# Altium project Battery ORing.PrjPcb
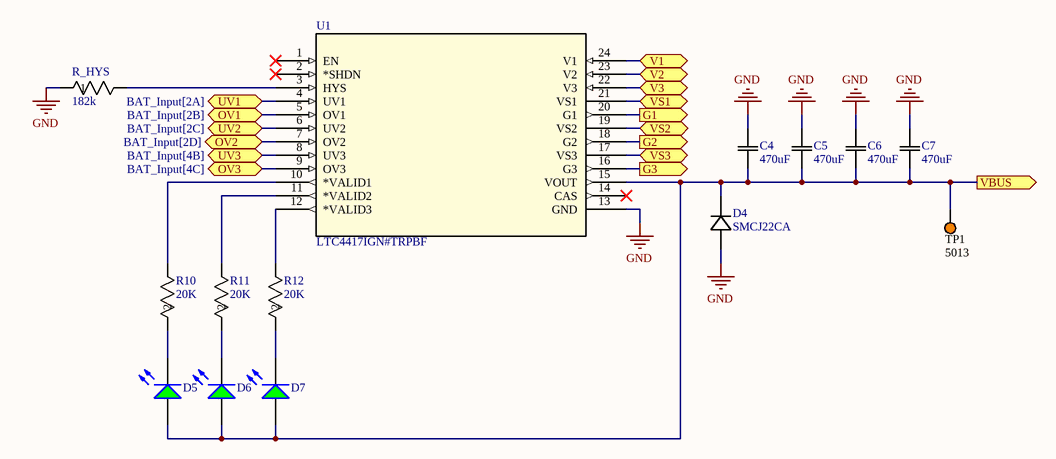
[diagram p0: Battery_Logic.SchDoc]
4 sheets, 116 parts. Net scope: flat (ports and power ports of the same name join across sheets).
Board file: Power_MUX_PCB.PcbDoc
Sheets:
  Battery_Logic.SchDoc
  FET_PowerPath.SchDoc
  BAT_Input.SchDoc
  Buck_Converter.SchDoc

## Sheet Battery_Logic.SchDoc
size A; SheetNumber: 1; SheetTotal: 4

### Parts
C4  470uF  [CAP_EEHZ-G16_PAN]
C5  470uF  [CAP_EEHZ-G16_PAN]
C6  470uF  [CAP_EEHZ-G16_PAN]
C7  470uF  [CAP_EEHZ-G16_PAN]
D4  SMCJ22CA  [SMCJSeries_LTF]
D5  597-3311-407F  [DIAL-597-3311-407F_V]  (value not drawn)
D6  597-3311-407F  [DIAL-597-3311-407F_V]  (value not drawn)
D7  597-3311-407F  [DIAL-597-3311-407F_V]  (value not drawn)
R10  20K  [RC0603N_PAN]
R11  20K  [RC0603N_PAN]
R12  20K  [RC0603N_PAN]
R_HYS  182k  [RES_RMCF0603_STP]
TP1  5013  [KSTN-5013_V]
U1  LTC4417IGN#TRPBF  [SSOP-24_GN_LIT]

### Ports
G1 (out, see FET_PowerPath[3A], FET_PowerPath[4A]), G2 (out, see FET_PowerPath[3C], FET_PowerPath[4C]), G3 (out, see FET_PowerPath[3D], FET_PowerPath[4D]), OV1 (bidir, see BAT_Input[2B]), OV2 (bidir, see BAT_Input[2D]), OV3 (bidir, see BAT_Input[4C]), UV1 (bidir, see BAT_Input[2A]), UV2 (bidir, see BAT_Input[2C]), UV3 (bidir, see BAT_Input[4B]), V1 (bidir, see BAT_Input[2A], FET_PowerPath[2A]), V2 (bidir, see BAT_Input[2C], FET_PowerPath[2B]), V3 (bidir, see BAT_Input[4B], FET_PowerPath[2C]), VBUS (out, see Buck_Converter[1C], FET_PowerPath[5A], FET_PowerPath[5B], FET_PowerPath[5C]), VS1 (bidir, see FET_PowerPath[4B]), VS2 (bidir, see FET_PowerPath[4C]), VS3 (bidir, see FET_PowerPath[4D])

### Nets
GND: C4.2 C5.2 C6.2 C7.2 D4.2 R_HYS.1 U1.13(GND)
VBAT1: U1.24(V1) ; port V1
VBAT2: U1.23(V2) ; port V2
VBAT3: U1.22(V3) ; port V3
VBUS: C4.1 C5.1 C6.1 C7.1 D4.1 D5.1(A) D6.1(A) D7.1(A) TP1.1 U1.15(VOUT) ; port VBUS
NetC1_1: U1.4(UV1) ; port UV1
NetC2_1: U1.6(UV2) ; port UV2
NetC3_2: U1.8(UV3) ; port UV3
NetC_VS1_1: U1.21(VS1) ; port VS1
NetC_VS2_1: U1.19(VS2) ; port VS2
NetC_VS3_1: U1.17(VS3) ; port VS3
NetD5_2: D5.2(K) R10.2
NetD6_2: D6.2(K) R11.2
NetD7_2: D7.2(K) R12.2
NetR1_2: U1.5(OV1) ; port OV1
NetR4_2: U1.7(OV2) ; port OV2
NetR7_2: U1.9(OV3) ; port OV3
NetR10_1: R10.1 U1.10(*VALID1)
NetR11_1: R11.1 U1.11(*VALID2)
NetR12_1: R12.1 U1.12(*VALID3)
NetR13_2: U1.20(G1) ; port G1
NetR17_2: U1.18(G2) ; port G2
NetR21_2: U1.16(G3) ; port G3
NetR_HYS_2: R_HYS.2 U1.3(HYS)

Not connected (* = marked no-connect by the designer): U1 1(EN)* 2(*SHDN)* 14(CAS)*

### Library data of the parts
C4-C7 = EEHZU1V471V: Description; Manufacturer_Name: Panasonic; Copyright: Copyright (C) 2025 Ultra Librarian. All rights reserved.; Manufacturer_Part_Number: EEHZU1V471V
D4 = SMCJ22CA: No Description Available; Manufacturer_Name: Littelfuse Inc; Copyright: Copyright (C) 2026 Ultra Librarian. All rights reserved.; Manufacturer_Part_Number: SMCJ22CA
D5-D7 = CMP-2000-05651-1: LED Green, 75 mW, 30 mA, -30 to 85 degC, 2-Pin SMD, RoHS, Tape and Reel; Manufacturer: Dialight; Product Depth (mm): 1.5mm; Viewing Angle: 70deg; DELETED: Compliant; Number of  Elements: 1; Emitting Color: YellowGreen; Shape Type: Rectangular; Product Length (mm): 3mm; Forward Current: 30mA; Main Category: ChipLED; Luminous Intensity: 7.5mcd; Type: Uni-Color; High Brightness: No; Test Current (It): 20mA; Lens Type: NonDiffused; Reverse Voltage: 4V; Peak Wavelength: 560nm; Power Dissipation: 75W; Forward Voltage: 2.5V; Chip Material: GaP; Mounting: SurfaceMount; Product Height (mm): 1.5mm; Pin Count: 2; Datasheet URL: https://datasheet.ciiva.com/15117/getdatasheetpartid-142484-15117764.pdf; Mounting Technology: SurfaceMount; Rad Hardened: No; Operating Temperature Classification: Commercial; Lens Dimensions: 2x1.5x0.9mm; Operating Temp Range: -30Cto85C; Package Reference: 597-3311-407F; Package Type: SMD; Datasheet Version: 07/2002; Lum Intensity: 7.5mcd; Packaging: TapeandReel; Package Description: 2-Pin Surface Mount Device, Body 1.5 x 3 mm; Manufacturer URL: http://www.dialight.com/
R10-R12 = ERJ-3EKF2002V: Description; Manufacturer_Name: Panasonic; Copyright: Copyright (C) 2025 Ultra Librarian. All rights reserved.; Manufacturer_Part_Number: ERJ-3EKF2002V
R_HYS = RMCF0603FT182K: No Description Available; Manufacturer_Name: Stackpole International; Copyright: Copyright (C) 2026 Ultra Librarian. All rights reserved.; Manufacturer_Part_Number: RMCF0603FT182K
TP1 = CMP-1672-00005-4: Test Point, Orange, Through Hole, RoHS, Bulk; Manufacturer: Keystone; REACH SVHC: No SVHC; ComponentLink2Description: Datasheet; PackageDescription: 1-Pin Through Hole Device, Dia 3.17 mm; Package Quantity: 100; PackageReference: 5013; Contact Material: Bronze; DatasheetVersion: Rev. F, 12/2013; ComponentLink2URL: http://www.keyelco.com/product-pdf.cfm?p=1322; Contact Plating: Silver; ComponentLink1URL: http://www.keyelco.com/; Packaging: Bulk; ComponentLink1Description: Manufacturer URL; Colour: Orange; Height: 8.12 mm; RoHSCompliant: True; Mount: Through Hole; Mounting Technology: Through Hole
U1 = LTC4417IGNTRPBF: Prioritized PowerPathâ„¢ Controller; Manufacturer_Name: Analog Devices Inc; Copyright: Copyright (C) 2025 Ultra Librarian. All rights reserved.; Manufacturer_Part_Number: LTC4417IGN#TRPBF; RefDes: RefDes; Type: Type

## Sheet FET_PowerPath.SchDoc
size 299 x 299 mm; SheetNumber: 2; SheetTotal: 4
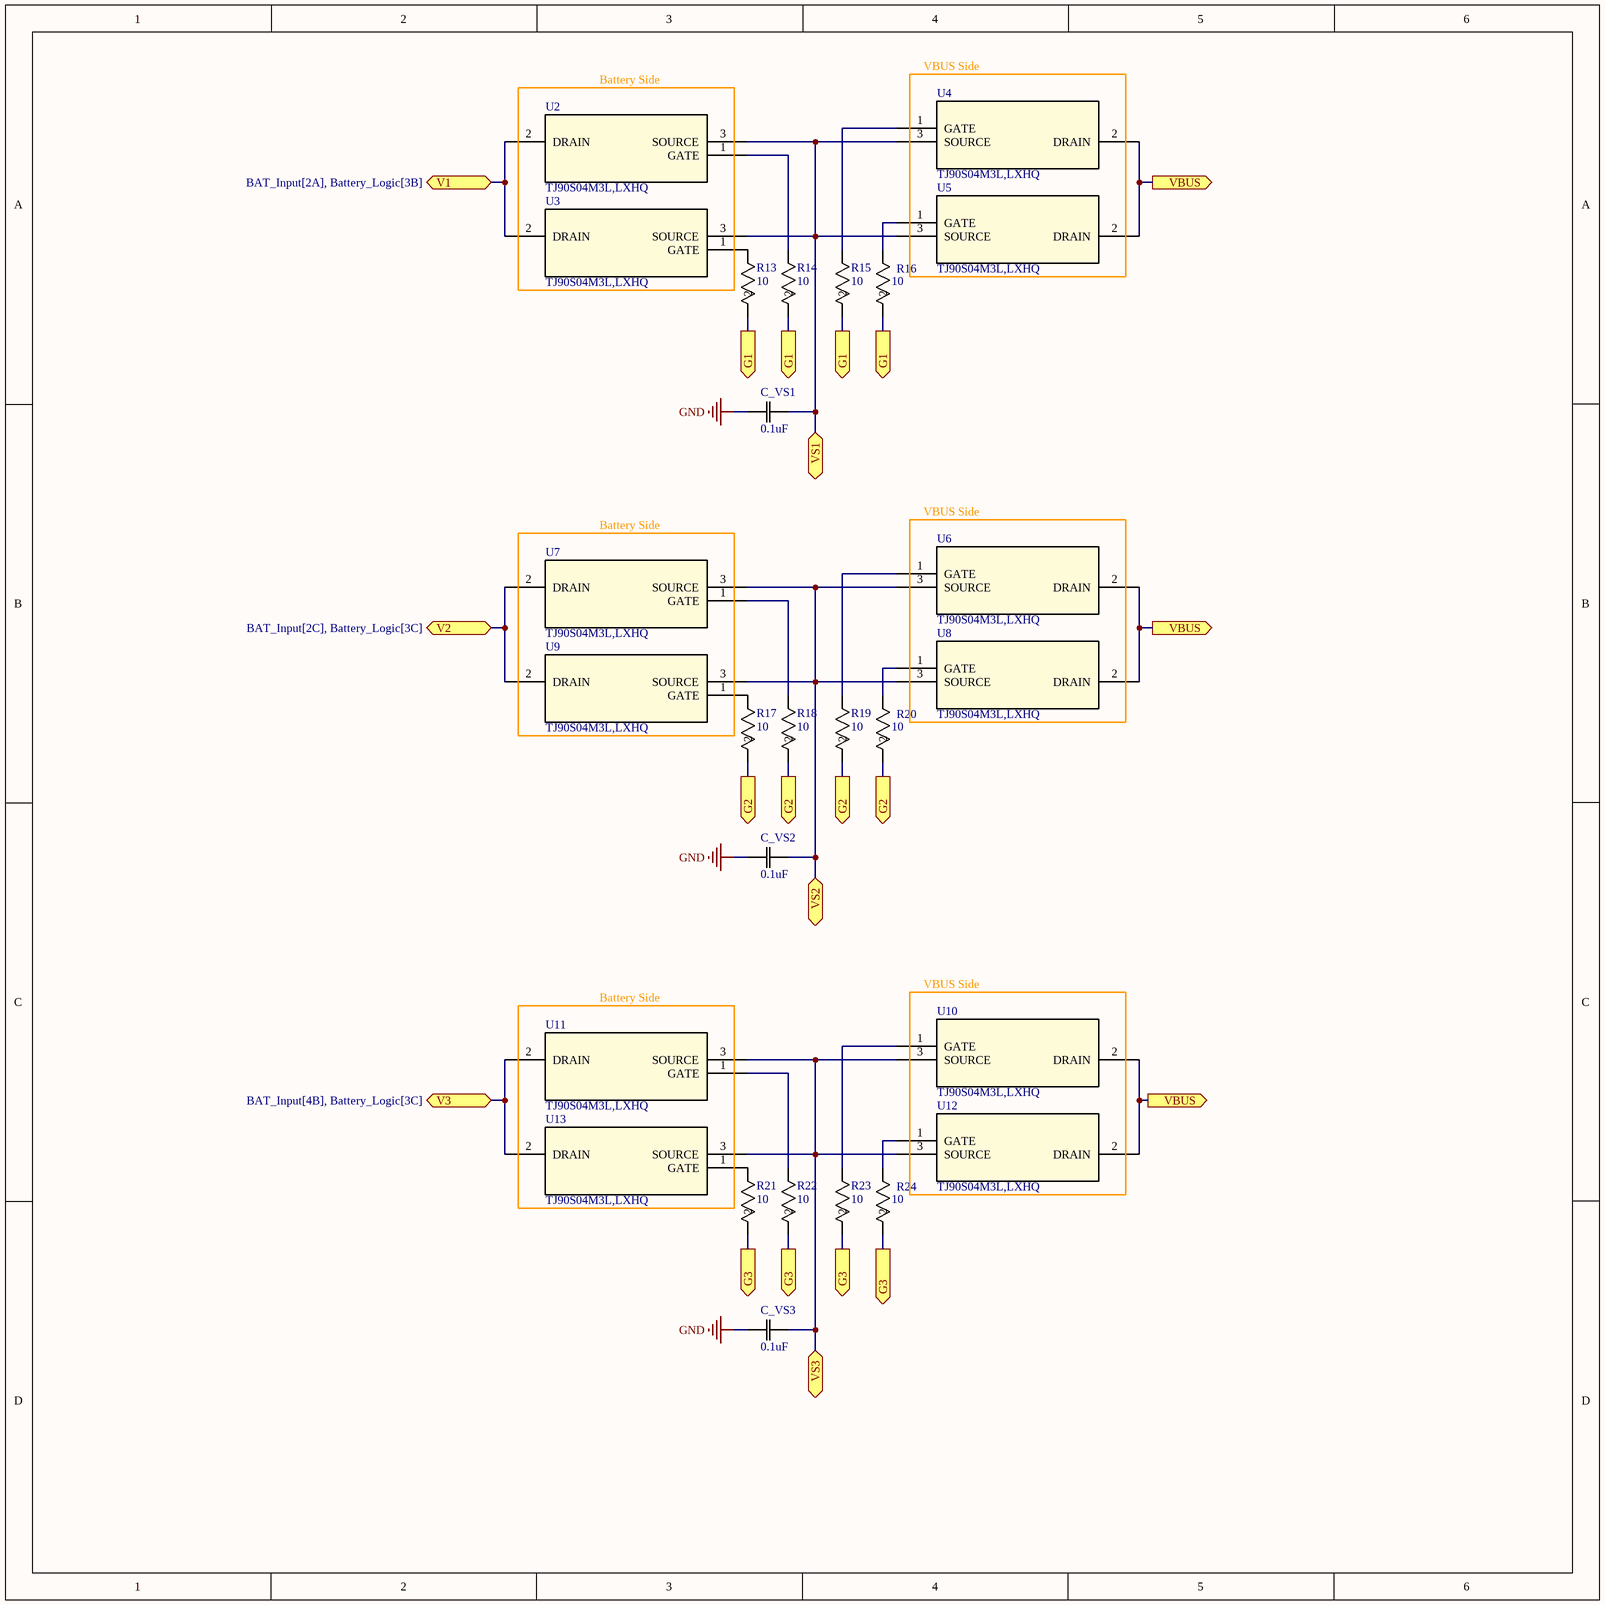
[diagram p1: FET_PowerPath.SchDoc]

### Parts
C_VS1  0.1uF  [CAP_GCM1555_0402_MUR]
C_VS2  0.1uF  [CAP_GCM1555_0402_MUR]
C_VS3  0.1uF  [CAP_GCM1555_0402_MUR]
R13  10  [RES_CRCW_0805]
R14  10  [RES_CRCW_0805]
R15  10  [RES_CRCW_0805]
R16  10  [RES_CRCW_0805]
R17  10  [RES_CRCW_0805]
R18  10  [RES_CRCW_0805]
R19  10  [RES_CRCW_0805]
R20  10  [RES_CRCW_0805]
R21  10  [RES_CRCW_0805]
R22  10  [RES_CRCW_0805]
R23  10  [RES_CRCW_0805]
R24  10  [RES_CRCW_0805]
U2  TJ90S04M3L,LXHQ  [DPAK+_TOS]
U3  TJ90S04M3L,LXHQ  [DPAK+_TOS]
U4  TJ90S04M3L,LXHQ  [DPAK+_TOS]
U5  TJ90S04M3L,LXHQ  [DPAK+_TOS]
U6  TJ90S04M3L,LXHQ  [DPAK+_TOS]
U7  TJ90S04M3L,LXHQ  [DPAK+_TOS]
U8  TJ90S04M3L,LXHQ  [DPAK+_TOS]
U9  TJ90S04M3L,LXHQ  [DPAK+_TOS]
U10  TJ90S04M3L,LXHQ  [DPAK+_TOS]
U11  TJ90S04M3L,LXHQ  [DPAK+_TOS]
U12  TJ90S04M3L,LXHQ  [DPAK+_TOS]
U13  TJ90S04M3L,LXHQ  [DPAK+_TOS]

### Blocks framed on the sheet
Battery Side: U2 U3
VBUS Side: U4 U5
Battery Side: U7 U9
VBUS Side: U6 U8
Battery Side: U11 U13
VBUS Side: U10 U12

### Ports
G1 (out, see Battery_Logic[3C], FET_PowerPath[3A], FET_PowerPath[4A]), G2 (out, see Battery_Logic[3C], FET_PowerPath[3C], FET_PowerPath[4C]), G3 (out, see Battery_Logic[3C], FET_PowerPath[3D], FET_PowerPath[4D]), V1 (bidir, see BAT_Input[2A], Battery_Logic[3B]), V2 (bidir, see BAT_Input[2C], Battery_Logic[3C]), V3 (bidir, see BAT_Input[4B], Battery_Logic[3C]), VBUS (out, see Battery_Logic[4C], Buck_Converter[1C], FET_PowerPath[5A], FET_PowerPath[5B]), VBUS (out, see Battery_Logic[4C], Buck_Converter[1C], FET_PowerPath[5A], FET_PowerPath[5C]), VBUS (out, see Battery_Logic[4C], Buck_Converter[1C], FET_PowerPath[5B], FET_PowerPath[5C]), VS1 (bidir, see Battery_Logic[3C]), VS2 (bidir, see Battery_Logic[3C]), VS3 (bidir, see Battery_Logic[3C])

### Nets
GND: C_VS1.2 C_VS2.2 C_VS3.2
VBAT1: U2.2(DRAIN) U3.2(DRAIN) ; port V1
VBAT2: U7.2(DRAIN) U9.2(DRAIN) ; port V2
VBAT3: U11.2(DRAIN) U13.2(DRAIN) ; port V3
VBUS: U4.2(DRAIN) U5.2(DRAIN) U6.2(DRAIN) U8.2(DRAIN) U10.2(DRAIN) U12.2(DRAIN) ; port VBUS
NetC_VS1_1: C_VS1.1 U2.3(SOURCE) U3.3(SOURCE) U4.3(SOURCE) U5.3(SOURCE) ; port VS1
NetC_VS2_1: C_VS2.1 U6.3(SOURCE) U7.3(SOURCE) U8.3(SOURCE) U9.3(SOURCE) ; port VS2
NetC_VS3_1: C_VS3.1 U10.3(SOURCE) U11.3(SOURCE) U12.3(SOURCE) U13.3(SOURCE) ; port VS3
NetR13_1: R13.1 U3.1(GATE)
NetR13_2: R13.2 R14.2 R15.2 R16.2 ; port G1
NetR14_1: R14.1 U2.1(GATE)
NetR15_1: R15.1 U4.1(GATE)
NetR16_1: R16.1 U5.1(GATE)
NetR17_1: R17.1 U9.1(GATE)
NetR17_2: R17.2 R18.2 R19.2 R20.2 ; port G2
NetR18_1: R18.1 U7.1(GATE)
NetR19_1: R19.1 U6.1(GATE)
NetR20_1: R20.1 U8.1(GATE)
NetR21_1: R21.1 U13.1(GATE)
NetR21_2: R21.2 R22.2 R23.2 R24.2 ; port G3
NetR22_1: R22.1 U11.1(GATE)
NetR23_1: R23.1 U10.1(GATE)
NetR24_1: R24.1 U12.1(GATE)

### Library data of the parts
C_VS1-C_VS3 = GCM155R71H104KE02J: Description; Manufacturer_Name: Murata; Copyright: Copyright (C) 2026 Ultra Librarian. All rights reserved.; Manufacturer_Part_Number: GCM155R71H104KE02J
R13-R24 = CRCW080510R0FKEA: D12/CRCW0805 100 10R 1% ET1 e3; Manufacturer_Name: Vishay; Copyright: Copyright (C) 2026 Ultra Librarian. All rights reserved.; Manufacturer_Part_Number: CRCW080510R0FKEA
U2-U13 = TJ90S04M3L,LXHQ: P-ch MOSFET, -40 V, -90 A, 0.0043 Î©@10V, DPAK+; Manufacturer_Name: Toshiba Electronic Devices & Storage Corp.; Copyright: Copyright (C) 2026 Ultra Librarian. All rights reserved.; Manufacturer_Part_Number: TJ90S04M3L,LXHQ; Datasheet: https://toshiba.semicon-storage.com/info/docget.jsp?did=58174&prodName=TJ90S04M3L; RefDes: RefDes; Type: Type

## Sheet BAT_Input.SchDoc
size A; SheetNumber: 3; SheetTotal: 4
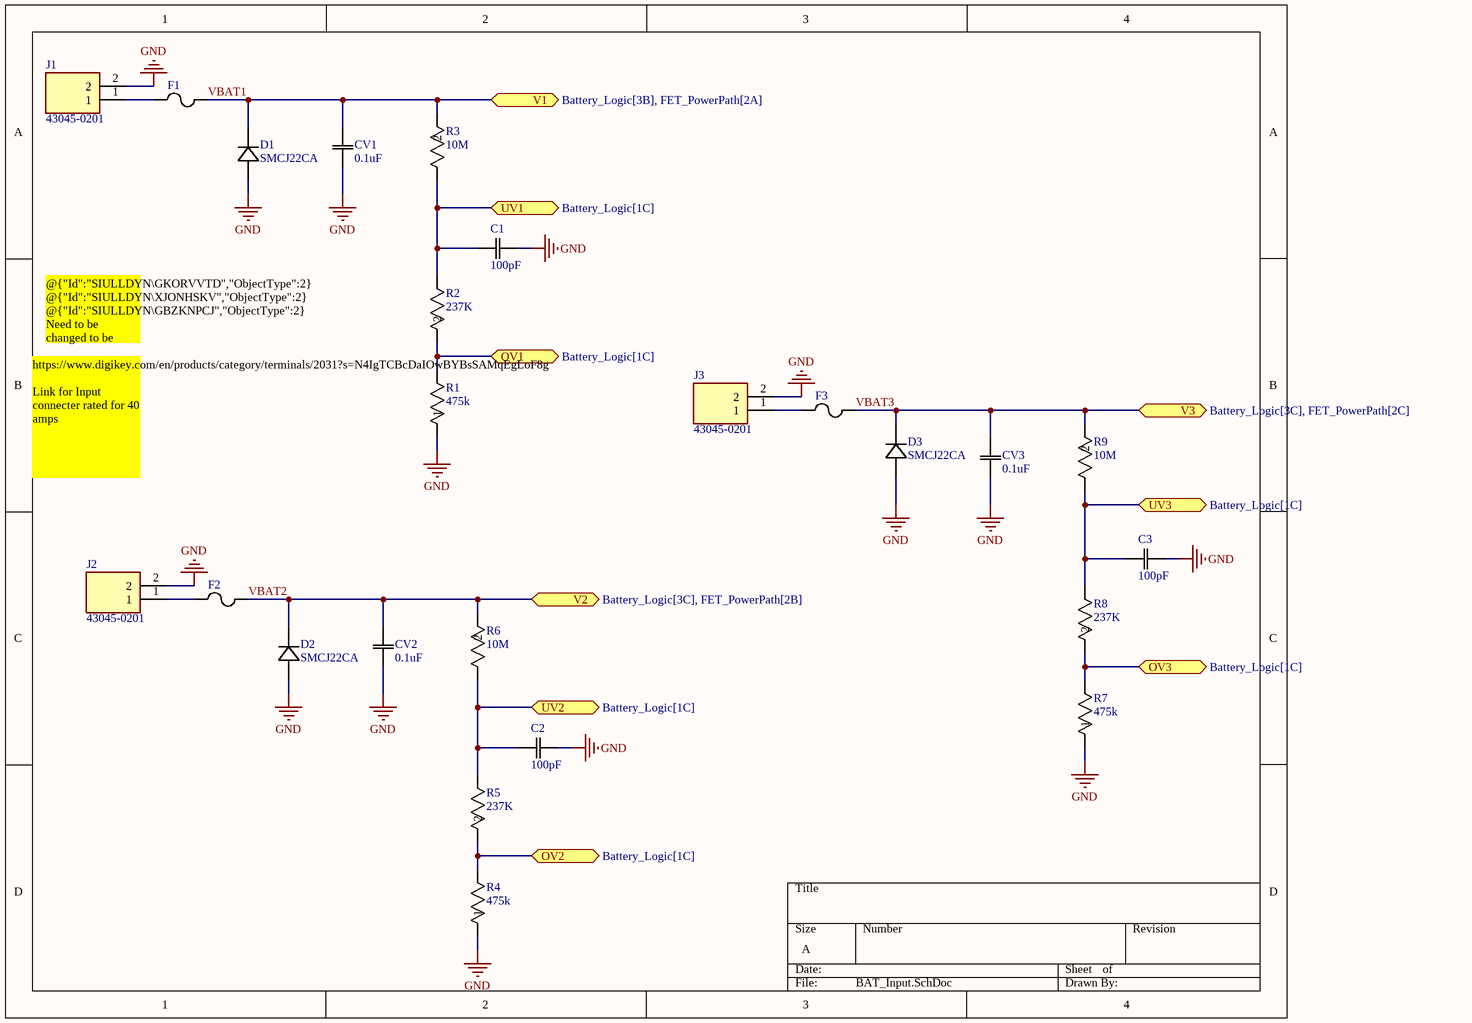
[diagram p2: BAT_Input.SchDoc]

### Parts
C1  100pF  [CAP_CC0402_YAG]
C2  100pF  [CAP_CC0402_YAG]
C3  100pF  [CAP_CC0402_YAG]
CV1  0.1uF  [CAP_GCM1555_0402_MUR]
CV2  0.1uF  [CAP_GCM1555_0402_MUR]
CV3  0.1uF  [CAP_GCM1555_0402_MUR]
D1  SMCJ22CA  [SMCJSeries_LTF]
D2  SMCJ22CA  [SMCJSeries_LTF]
D3  SMCJ22CA  [SMCJSeries_LTF]
F1  SF-3812F4000T-2  [FUSE_L20A_BRN]  (value not drawn)
F2  SF-3812F4000T-2  [FUSE_L20A_BRN]  (value not drawn)
F3  SF-3812F4000T-2  [FUSE_L20A_BRN]  (value not drawn)
J1  43045-0201  [43045-02YY]
J2  43045-0201  [43045-02YY]
J3  43045-0201  [43045-02YY]
R1  475k  [STA_RMCF0603_STP]
R2  237K  [RC0603N_PAN]
R3  10M  [RES_CRCW_0603]
R4  475k  [STA_RMCF0603_STP]
R5  237K  [RC0603N_PAN]
R6  10M  [RES_CRCW_0603]
R7  475k  [STA_RMCF0603_STP]
R8  237K  [RC0603N_PAN]
R9  10M  [RES_CRCW_0603]

### Ports
OV1 (bidir, see Battery_Logic[1C]), OV2 (bidir, see Battery_Logic[1C]), OV3 (bidir, see Battery_Logic[1C]), UV1 (bidir, see Battery_Logic[1C]), UV2 (bidir, see Battery_Logic[1C]), UV3 (bidir, see Battery_Logic[1C]), V1 (bidir, see Battery_Logic[3B], FET_PowerPath[2A]), V2 (bidir, see Battery_Logic[3C], FET_PowerPath[2B]), V3 (bidir, see Battery_Logic[3C], FET_PowerPath[2C])

### Nets
GND: C1.2 C2.2 C3.1 CV1.1 CV2.1 CV3.1 D1.2 D2.2 D3.2 J1.2 J2.2 J3.2 R1.1 R4.1 R7.1
VBAT1: CV1.2 D1.1 F1.2 R3.2 ; port V1
VBAT2: CV2.2 D2.1 F2.2 R6.2 ; port V2
VBAT3: CV3.2 D3.1 F3.2 R9.2 ; port V3
NetC1_1: C1.1 R2.1 R3.1 ; port UV1
NetC2_1: C2.1 R5.1 R6.1 ; port UV2
NetC3_2: C3.2 R8.1 R9.1 ; port UV3
NetF1_1: F1.1 J1.1
NetF2_1: F2.1 J2.1
NetF3_1: F3.1 J3.1
NetR1_2: R1.2 R2.2 ; port OV1
NetR4_2: R4.2 R5.2 ; port OV2
NetR7_2: R7.2 R8.2 ; port OV3

### Notes on the sheet
- @{"Id":"SIULLDYN\GKORVVTD","ObjectType":2} @{"Id":"SIULLDYN\XJONHSKV","ObjectType":2} @{"Id":"SIULLDYN\GBZKNPCJ","ObjectType":2} Need to be changed to be rated for 40A. Connecters in from battery terminals.
- https://www.digikey.com/en/products/category/terminals/2031?s=N4IgTCBcDaIOwBYBsSAMqEgLoF8g
  Link for Input connecter rated for 40 amps

### Library data of the parts
C1-C3 = CC0402JRNPO9BN101: CAPACITOR; SMT (0402); CERAMIC CHIP; 100PF; 50V; TOL=5%; TG=-55 DEGC TO +125 DEGC; TC=C0G; Manufacturer_Name: Yageo; Copyright: Copyright (C) 2025 Ultra Librarian. All rights reserved.; Manufacturer_Part_Number: CC0402JRNPO9BN101
CV1-CV3 = GCM155R71H104KE02J: Description; Manufacturer_Name: Murata; Copyright: Copyright (C) 2026 Ultra Librarian. All rights reserved.; Manufacturer_Part_Number: GCM155R71H104KE02J
D1-D3 = SMCJ22CA: as D4 on sheet Battery_Logic; Copyright: Copyright (C) 2026 Ultra Librarian. All rights reserved.; Manufacturer_Part_Number: SMCJ22CA
F1-F3 = SF-3812F4000T-2: Description; Manufacturer_Name: Bourns Electronics; Copyright: Copyright (C) 2026 Ultra Librarian. All rights reserved.; Manufacturer_Part_Number: SF-3812F4000T-2
J1-J3 = 43045-0201: Connector; Manufacturer_Name: Molex; Datasheet Link: https://www.molex.com/pdm_docs/sd/430450200_sd.pdf; Height: 9.9mm; Manufacturer_Part_Number: 43045-0201; Mouser Part Number: 538-43045-0201; Mouser Price/Stock: https://www.mouser.co.uk/ProductDetail/Molex/43045-0201?qs=R7%2FZKp6KZ2Y51sj1nic43g%3D%3D
R1 R4 R7 = RMCF0603FT475K: No Description Available; Manufacturer_Name: Stackpole International; Copyright: Copyright (C) 2026 Ultra Librarian. All rights reserved.; Manufacturer_Part_Number: RMCF0603FT475K
R2 R5 R8 = ERJ-3EKF2373V: No Description Available; Manufacturer_Name: Panasonic; Copyright: Copyright (C) 2026 Ultra Librarian. All rights reserved.; Manufacturer_Part_Number: ERJ-3EKF2373V
R3 R6 R9 = CRCW060310M0FKEA: D11/CRCW0603 100 10M 1% ET1 e3; Manufacturer_Name: Vishay; Copyright: Copyright (C) 2025 Ultra Librarian. All rights reserved.; Manufacturer_Part_Number: CRCW060310M0FKEA

## Sheet Buck_Converter.SchDoc
size B; SheetNumber: 4; SheetTotal: 4
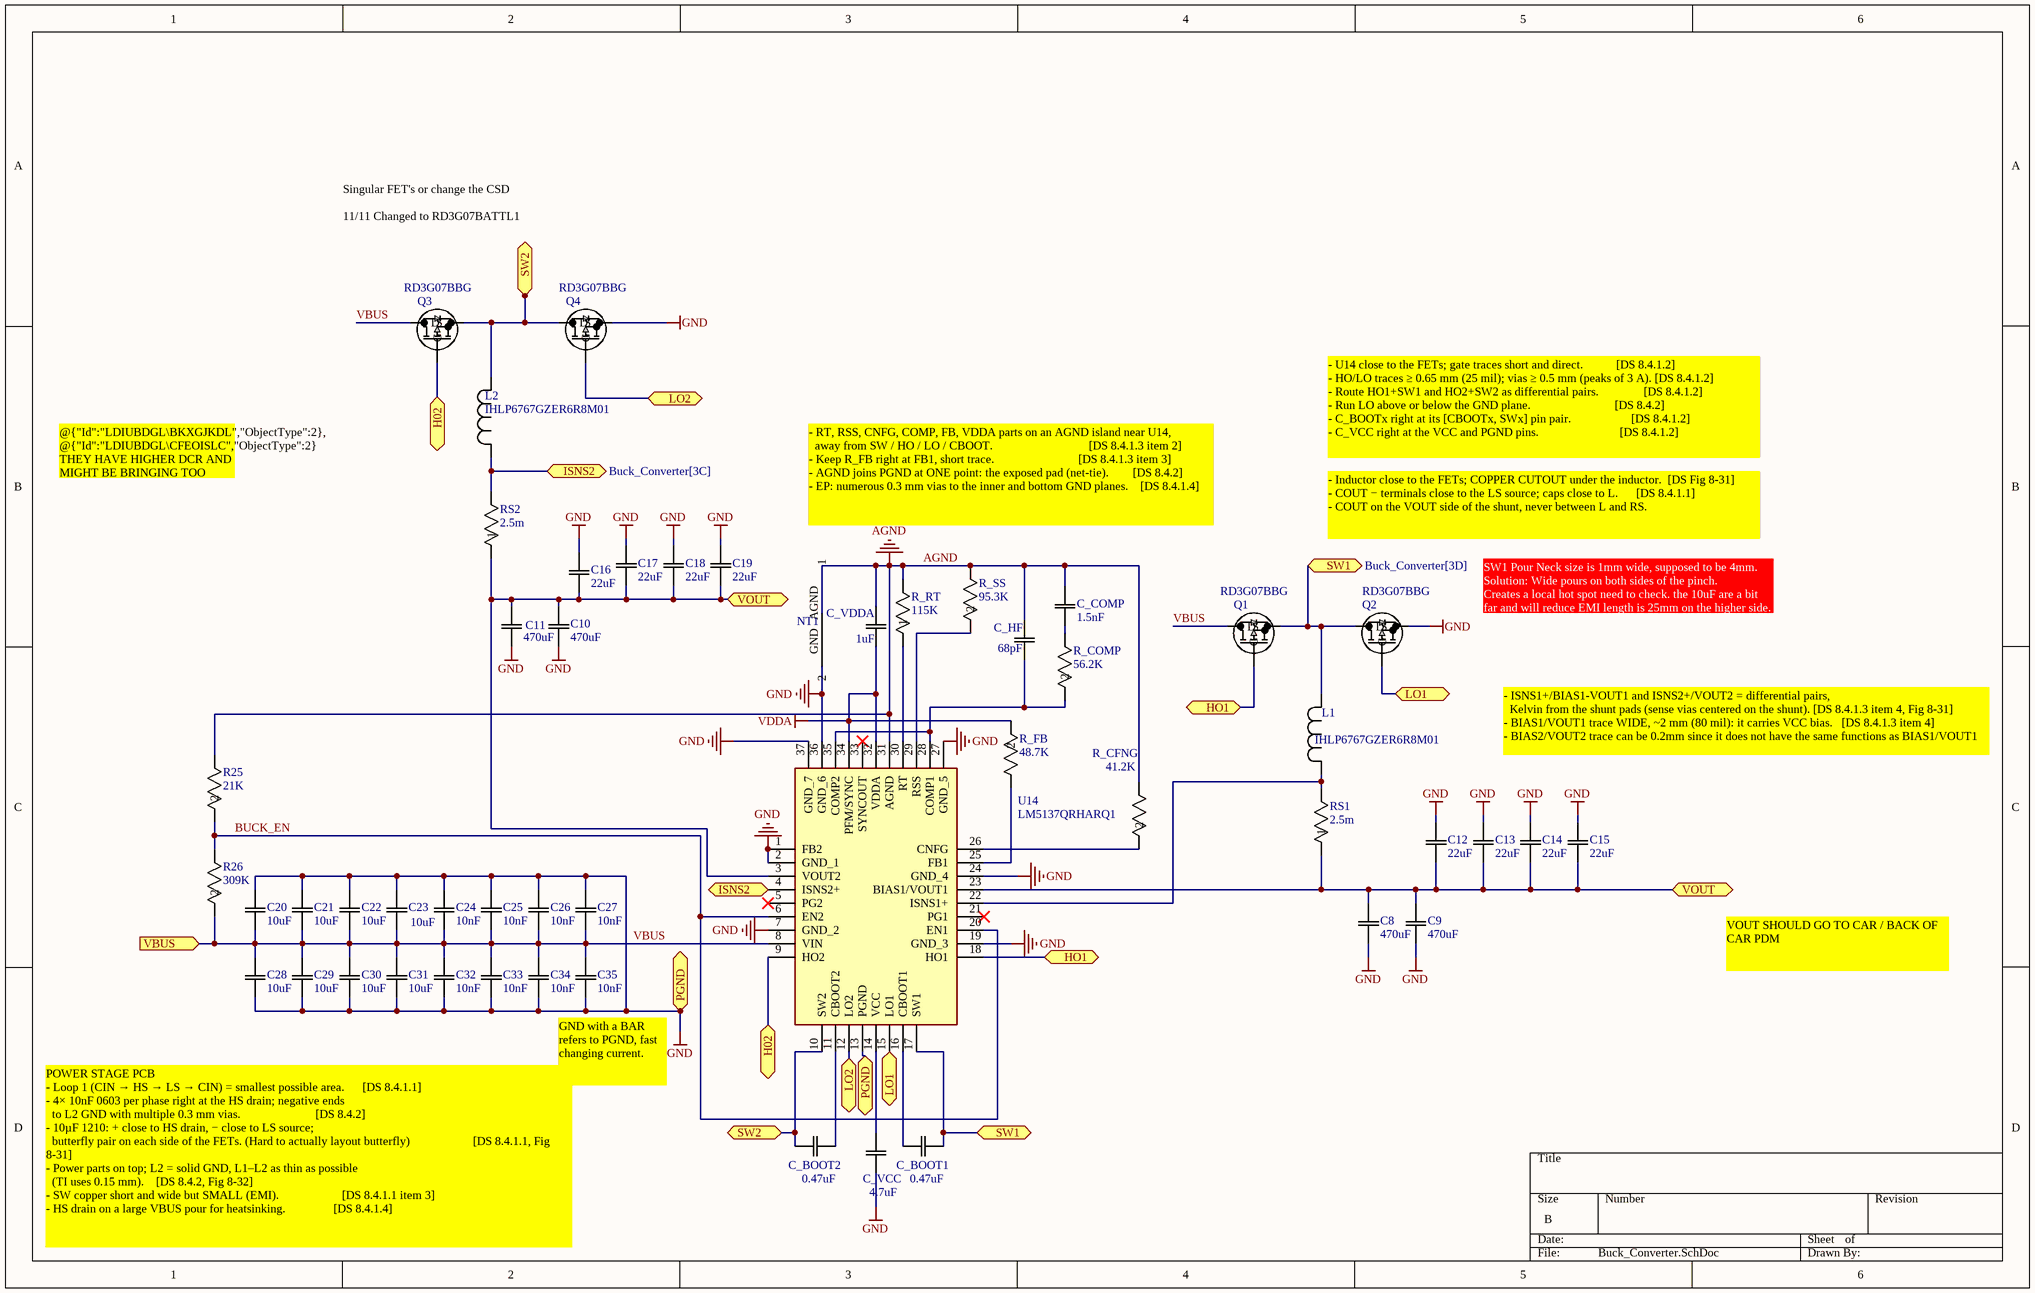
[diagram p3: Buck_Converter.SchDoc]

### Parts
C8  470uF  [CAP_EEHZ-G16_PAN]
C9  470uF  [CAP_EEHZ-G16_PAN]
C10  470uF  [CAP_EEHZ-G16_PAN]
C11  470uF  [CAP_EEHZ-G16_PAN]
C12  22uF  [CAP_CGA6_TDK]
C13  22uF  [CAP_CGA6_TDK]
C14  22uF  [CAP_CGA6_TDK]
C15  22uF  [CAP_CGA6_TDK]
C16  22uF  [CAP_CGA6_TDK]
C17  22uF  [CAP_CGA6_TDK]
C18  22uF  [CAP_CGA6_TDK]
C19  22uF  [CAP_CGA6_TDK]
C20  10uF  [CAP_CL32_SAM]
C21  10uF  [CAP_CL32_SAM]
C22  10uF  [CAP_CL32_SAM]
C23  10uF  [CAP_CL32_SAM]
C24  10nF  [G-155_MUR]
C25  10nF  [G-155_MUR]
C26  10nF  [G-155_MUR]
C27  10nF  [G-155_MUR]
C28  10uF  [CAP_CL32_SAM]
C29  10uF  [CAP_CL32_SAM]
C30  10uF  [CAP_CL32_SAM]
C31  10uF  [CAP_CL32_SAM]
C32  10nF  [G-155_MUR]
C33  10nF  [G-155_MUR]
C34  10nF  [G-155_MUR]
C35  10nF  [G-155_MUR]
C_BOOT1  0.47uF  [CAP_CL10_SAM]
C_BOOT2  0.47uF  [CAP_CL10_SAM]
C_COMP  1.5nF  [G-188_MUR]
C_HF  68pF  [CAP_CL10_SAM]
C_VCC  4.7uF  [CAP_TMK212AB7475KG-T_TAY]
C_VDDA  1uF  [CAPC17595_90N_KEM]
L1  IHLP6767GZER6R8M01  [IND_IHLP-6767GZ_VIS]
L2  IHLP6767GZER6R8M01  [IND_IHLP-6767GZ_VIS]
NT1  (no value)  [NetTie]  (net tie, no BOM)
Q1  RD3G07BBG  [DPAK_TO-252_ROM]
Q2  RD3G07BBG  [DPAK_TO-252_ROM]
Q3  RD3G07BBG  [DPAK_TO-252_ROM]
Q4  RD3G07BBG  [DPAK_TO-252_ROM]
R25  21K  [RC0603N_YAG]
R26  309K  [RC0603N_PAN]
R_CFNG  41.2K  [RC0603N_PAN]
R_COMP  56.2K  [RES_CRCW_0603]
R_FB  48.7K  [RES_CRCW_0603]
R_RT  115K  [RES_RMCF0603_STP]
R_SS  95.3K  [RC0603N_PAN]
RS1  2.5m  [RES_WSLP3921_.002OHM_VIS]
RS2  2.5m  [RES_WSLP3921_.002OHM_VIS]
U14  LM5137QRHARQ1  [LM5137QRHARQ1]

### Ports
H02 (bidir, see Buck_Converter[2B]), H02 (bidir, see Buck_Converter[3D]), HO1 (bidir, see Buck_Converter[4C]), ISNS2 (bidir, see Buck_Converter[2B]), ISNS2 (bidir, see Buck_Converter[3C]), LO1 (bidir, see Buck_Converter[3D]), LO1 (bidir, see Buck_Converter[5C]), LO2 (bidir, see Buck_Converter[2B]), LO2 (bidir, see Buck_Converter[3D]), PGND (bidir, see Buck_Converter[3D]), SW1 (bidir, see Buck_Converter[3D]), SW1 (bidir, see Buck_Converter[4B]), SW2 (bidir, see Buck_Converter[2A]), SW2 (bidir, see Buck_Converter[3D]), VBUS (in, see Battery_Logic[4C], FET_PowerPath[5A], FET_PowerPath[5B], FET_PowerPath[5C]), VOUT (bidir, see Buck_Converter[3B]), VOUT (bidir, see Buck_Converter[5C])

### Nets
AGND: C_COMP.2 C_HF.2 C_VDDA.2 NT1.AGND(1) R25.1 R_CFNG.1 R_RT.2 R_SS.1 U14.31(AGND)
GND: C8.1 C9.1 C10.2 C11.2 C12.1 C13.1 C14.1 C15.1 C16.1 C17.1 C18.1 C19.1 C20.1 C21.1 C22.1 C23.1 C24.2 C25.2 C26.2 C27.2 C28.2 C29.2 C30.2 C31.2 C32.1 C33.1 C34.1 C35.1 C_VCC.1 Q2.3(S) Q4.3(S) U14.1(FB2) U14.2(GND_1) U14.7(GND_2) U14.13(PGND) U14.19(GND_3) U14.24(GND_4) U14.27(GND_5) U14.36(GND_6) U14.37(GND_7) ; port PGND
VDDA: C_VDDA.1 R_FB.2 U14.32(VDDA) U14.34(PFM/SYNC)
BUCK_EN: R25.2 R26.1 U14.6(EN2) U14.20(EN1)
VBUS: C20.2 C21.2 C22.2 C23.2 C24.1 C25.1 C26.1 C27.1 C28.1 C29.1 C30.1 C31.1 C32.2 C33.2 C34.2 C35.2 Q1.2(D) Q3.2(D) R26.2 U14.8(VIN) ; port VBUS
NetC8_2: C8.2 C9.2 C10.1 C11.1 C12.2 C13.2 C14.2 C15.2 C16.2 C17.2 C18.2 C19.2 RS1.1 RS2.1 U14.3(VOUT2) U14.23(BIAS1/VOUT1) ; port VOUT
NetC_BOOT1_1: C_BOOT1.1 U14.16(CBOOT1)
NetC_BOOT1_2: C_BOOT1.2 L1.1 Q1.3(S) Q2.2(D) U14.17(SW1) ; port SW1
NetC_BOOT2_1: C_BOOT2.1 U14.11(CBOOT2)
NetC_BOOT2_2: C_BOOT2.2 L2.1 Q3.3(S) Q4.2(D) U14.10(SW2) ; port SW2
NetC_COMP_1: C_COMP.1 R_COMP.1
NetC_HF_1: C_HF.1 R_COMP.2 U14.28(COMP1) U14.35(COMP2)
NetC_VCC_2: C_VCC.2 U14.14(VCC)
NetL1_2: L1.2 RS1.2 U14.22(ISNS1+)
NetL2_2: L2.2 RS2.2 U14.4(ISNS2+) ; port ISNS2
NetQ1_1: Q1.1(G) U14.18(HO1) ; port HO1
NetQ2_1: Q2.1(G) U14.15(LO1) ; port LO1
NetQ3_1: Q3.1(G) U14.9(HO2) ; port H02
NetQ4_1: Q4.1(G) U14.12(LO2) ; port LO2
NetR_CFNG_2: R_CFNG.2 U14.26(CNFG)
NetR_FB_1: R_FB.1 U14.25(FB1)
NetR_RT_1: R_RT.1 U14.30(RT)
NetR_SS_2: R_SS.2 U14.29(RSS)

Not connected (* = marked no-connect by the designer): NT1 GND(2); U14 5(PG2)* 21(PG1)* 33(SYNCOUT)*

### Notes on the sheet
- Singular FET's or change the CSD
  11/11 Changed to RD3G07BATTL1
- @{"Id":"LDIUBDGL\BKXGJKDL","ObjectType":2}, @{"Id":"LDIUBDGL\CFEOISLC","ObjectType":2} THEY HAVE HIGHER DCR AND MIGHT BE BRINGING TOO MUCH HEAT INTO THE FETS
- - U14 close to the FETs; gate traces short and direct.           [DS 8.4.1.2]
  - HO/LO traces ≥ 0.65 mm (25 mil); vias ≥ 0.5 mm (peaks of 3 A). [DS 8.4.1.2]
  - Route HO1+SW1 and HO2+SW2 as differential pairs.               [DS 8.4.1.2]
  - Run LO above or below the GND plane.                            [DS 8.4.2]
  - C_BOOTx right at its [CBOOTx, SWx] pin pair.                    [DS 8.4.1.2]
  - C_VCC right at the VCC and PGND pins.                           [DS 8.4.1.2]
- - RT, RSS, CNFG, COMP, FB, VDDA parts on an AGND island near U14,
  away from SW / HO / LO / CBOOT.                                [DS 8.4.1.3 item 2]
  - Keep R_FB right at FB1, short trace.                            [DS 8.4.1.3 item 3]
  - AGND joins PGND at ONE point: the exposed pad (net-tie).        [DS 8.4.2]
  - EP: numerous 0.3 mm vias to the inner and bottom GND planes.    [DS 8.4.1.4]
- - Inductor close to the FETs; COPPER CUTOUT under the inductor.  [DS Fig 8-31]
  - COUT − terminals close to the LS source; caps close to L.      [DS 8.4.1.1]
  - COUT on the VOUT side of the shunt, never between L and RS.
- SW1 Pour Neck size is 1mm wide, supposed to be 4mm.
  Solution: Wide pours on both sides of the pinch.
  Creates a local hot spot need to check. the 10uF are a bit far and will reduce EMI length is 25mm on the higher side.
- - ISNS1+/BIAS1-VOUT1 and ISNS2+/VOUT2 = differential pairs,
  Kelvin from the shunt pads (sense vias centered on the shunt). [DS 8.4.1.3 item 4, Fig 8-31]
  - BIAS1/VOUT1 trace WIDE, ~2 mm (80 mil): it carries VCC bias.   [DS 8.4.1.3 item 4]
  - BIAS2/VOUT2 trace can be 0.2mm since it does not have the same functions as BIAS1/VOUT1
- VOUT SHOULD GO TO CAR / BACK OF CAR PDM
- GND with a BAR refers to PGND, fast changing current.
- POWER STAGE PCB
  - Loop 1 (CIN → HS → LS → CIN) = smallest possible area.      [DS 8.4.1.1]
  - 4× 10nF 0603 per phase right at the HS drain; negative ends
  to L2 GND with multiple 0.3 mm vias.                         [DS 8.4.2]
  - 10µF 1210: + close to HS drain, − close to LS source;
  butterfly pair on each side of the FETs. (Hard to actually layout butterfly)                     [DS 8.4.1.1, Fig 8-31]
  - Power parts on top; L2 = solid GND, L1–L2 as thin as possible
  (TI uses 0.15 mm).    [DS 8.4.2, Fig 8-32]
  - SW copper short and wide but SMALL (EMI).                     [DS 8.4.1.1 item 3]
  - HS drain on a large VBUS pour for heatsinking.                [DS 8.4.1.4]

### Library data of the parts
C8-C11 = EEHZU1V471V: as C4 on sheet Battery_Logic; Copyright: Copyright (C) 2025 Ultra Librarian. All rights reserved.; Manufacturer_Part_Number: EEHZU1V471V
C12-C19 = CGA6P3X7R1E226M250AB: Description; Manufacturer_Name: TDK; Copyright: Copyright (C) 2025 Ultra Librarian. All rights reserved.; Manufacturer_Part_Number: CGA6P3X7R1E226M250AB
C20-C23 C28-C31 = CL32B106KBJNNNE: Description; Manufacturer_Name: Samsung; Copyright: Copyright (C) 2025 Ultra Librarian. All rights reserved.; Manufacturer_Part_Number: CL32B106KBJNNNE
C24-C27 C32-C35 = GCM155R71H103KA55D: Description; Manufacturer_Name: Murata; Copyright: Copyright (C) 2025 Ultra Librarian. All rights reserved.; Manufacturer_Part_Number: GCM155R71H103KA55D
C_BOOT1 C_BOOT2 = CL10B474KA8NFNC: Description; Manufacturer_Name: Samsung; Copyright: Copyright (C) 2026 Ultra Librarian. All rights reserved.; Manufacturer_Part_Number: CL10B474KA8NFNC
C_COMP = GRM1885C1H152JA01D: Description; Manufacturer_Name: Murata; Copyright: Copyright (C) 2025 Ultra Librarian. All rights reserved.; Manufacturer_Part_Number: GRM1885C1H152JA01D
C_HF = CL10C680JB8NNNC: No Description Available; Manufacturer_Name: Samsung; Copyright: Copyright (C) 2026 Ultra Librarian. All rights reserved.; Manufacturer_Part_Number: CL10C680JB8NNNC
C_VCC = TMK212AB7475KG-T: Description; Manufacturer_Name: Taiyo Yuden; Copyright: Copyright (C) 2025 Ultra Librarian. All rights reserved.; Manufacturer_Part_Number: TMK212AB7475KG-T
C_VDDA = C0603C105K4RACTU: SMD Comm X7R, Ceramic, 1 uF, 10%, 16 VDC, X7R, SMD, MLCC, Temperature Stable, Class II, 0603; Manufacturer_Name: Kemet; Copyright: Copyright (C) 2026 Ultra Librarian. All rights reserved.; Manufacturer_Part_Number: C0603C105K4RACTU
L1 L2 = IHLP6767GZER6R8M01: IHLP-6767GZ-01 6.8 20% ER E3; Manufacturer_Name: Vishay; Copyright: Copyright (C) 2025 Ultra Librarian. All rights reserved.; Manufacturer_Part_Number: IHLP6767GZER6R8M01
NT1 = NetTie: Net Tie for AGND and GND; pin to pad: AGND>1 GND>2
Q1-Q4 = RD3G07BATTL1: N-Channel; Manufacturer_Name: ROHM Semiconductor; Type: Transistors; Copyright: Copyright (C) 2026 Ultra Librarian. All rights reserved.; Manufacturer_Part_Number: RD3G07BATTL1
R25 = RC0603FR-0721KL: No Description Available; Manufacturer_Name: Yageo; Copyright: Copyright (C) 2026 Ultra Librarian. All rights reserved.; Manufacturer_Part_Number: RC0603FR-0721KL
R26 = ERJ-3EKF3093V: No Description Available; Manufacturer_Name: Panasonic; Copyright: Copyright (C) 2026 Ultra Librarian. All rights reserved.; Manufacturer_Part_Number: ERJ-3EKF3093V
R_CFNG = ERJ-3EKF4122V: Description; Manufacturer_Name: Panasonic; Copyright: Copyright (C) 2025 Ultra Librarian. All rights reserved.; Manufacturer_Part_Number: ERJ-3EKF4122V
R_COMP = CRCW060356K2FKEA: No Description Available; Manufacturer_Name: Vishay; Copyright: Copyright (C) 2026 Ultra Librarian. All rights reserved.; Manufacturer_Part_Number: CRCW060356K2FKEA; Datasheet: https://www.vishay.com/doc?20035
R_FB = CRCW060348K7FKEA: No Description Available; Manufacturer_Name: Vishay; Copyright: Copyright (C) 2026 Ultra Librarian. All rights reserved.; Manufacturer_Part_Number: CRCW060348K7FKEA; Datasheet: https://www.vishay.com/doc?20035
R_RT = RMCF0603FT115K: No Description Available; Manufacturer_Name: Stackpole International; Copyright: Copyright (C) 2026 Ultra Librarian. All rights reserved.; Manufacturer_Part_Number: RMCF0603FT115K
R_SS = ERJ-3EKF9532V: Description; Manufacturer_Name: Panasonic; Copyright: Copyright (C) 2026 Ultra Librarian. All rights reserved.; Manufacturer_Part_Number: ERJ-3EKF9532V
RS1 RS2 = WSLP39212L500FEA: WSLP3921 .0025 1% EA; Manufacturer_Name: Vishay; Copyright: Copyright (C) 2025 Ultra Librarian. All rights reserved.; Manufacturer_Part_Number: WSLP39212L500FEA
U14 = LM5137QRHARQ1: Switching Controllers Automotive, 80V, 100% duty-cycle capable dual-channel synchronous buck controller; Manufacturer_Name: Texas Instruments; Geometry.Height: 1mm; Mouser Part Number: *; Mouser Price/Stock: *; Manufacturer_Part_Number: LM5137QRHARQ1; Datasheet Link: https://www.ti.com/lit/ds/symlink/lm5137-q1.pdf?ts=1761300127638&ref_url=https%253A%252F%252Fwww.ti.com%252Fproduct%252FLM5137-Q1%252Fpart-details%252FLM5137QRHARQ1

## Nets that join several sheets
GND: Battery_Logic (7 pins), FET_PowerPath (C_VS1.2 C_VS2.2 C_VS3.2), BAT_Input (15 pins), Buck_Converter (40 pins)
NetC1_1: Battery_Logic (U1.4), BAT_Input (C1.1 R2.1 R3.1)
NetC2_1: Battery_Logic (U1.6), BAT_Input (C2.1 R5.1 R6.1)
NetC3_2: Battery_Logic (U1.8), BAT_Input (C3.2 R8.1 R9.1)
NetC_VS1_1: Battery_Logic (U1.21), FET_PowerPath (5 pins)
NetC_VS2_1: Battery_Logic (U1.19), FET_PowerPath (5 pins)
NetC_VS3_1: Battery_Logic (U1.17), FET_PowerPath (5 pins)
NetR1_2: Battery_Logic (U1.5), BAT_Input (R1.2 R2.2)
NetR4_2: Battery_Logic (U1.7), BAT_Input (R4.2 R5.2)
NetR7_2: Battery_Logic (U1.9), BAT_Input (R7.2 R8.2)
NetR13_2: Battery_Logic (U1.20), FET_PowerPath (R13.2 R14.2 R15.2 R16.2)
NetR17_2: Battery_Logic (U1.18), FET_PowerPath (R17.2 R18.2 R19.2 R20.2)
NetR21_2: Battery_Logic (U1.16), FET_PowerPath (R21.2 R22.2 R23.2 R24.2)
VBAT1: Battery_Logic (U1.24), FET_PowerPath (U2.2 U3.2), BAT_Input (CV1.2 D1.1 F1.2 R3.2)
VBAT2: Battery_Logic (U1.23), FET_PowerPath (U7.2 U9.2), BAT_Input (CV2.2 D2.1 F2.2 R6.2)
VBAT3: Battery_Logic (U1.22), FET_PowerPath (U11.2 U13.2), BAT_Input (CV3.2 D3.1 F3.2 R9.2)
VBUS: Battery_Logic (10 pins), FET_PowerPath (6 pins), Buck_Converter (20 pins)